# Altium schematic sheet RK3588-HDMI.SchDoc
size 420 x 297 mm; SheetNumber: 11; SheetTotal: 22
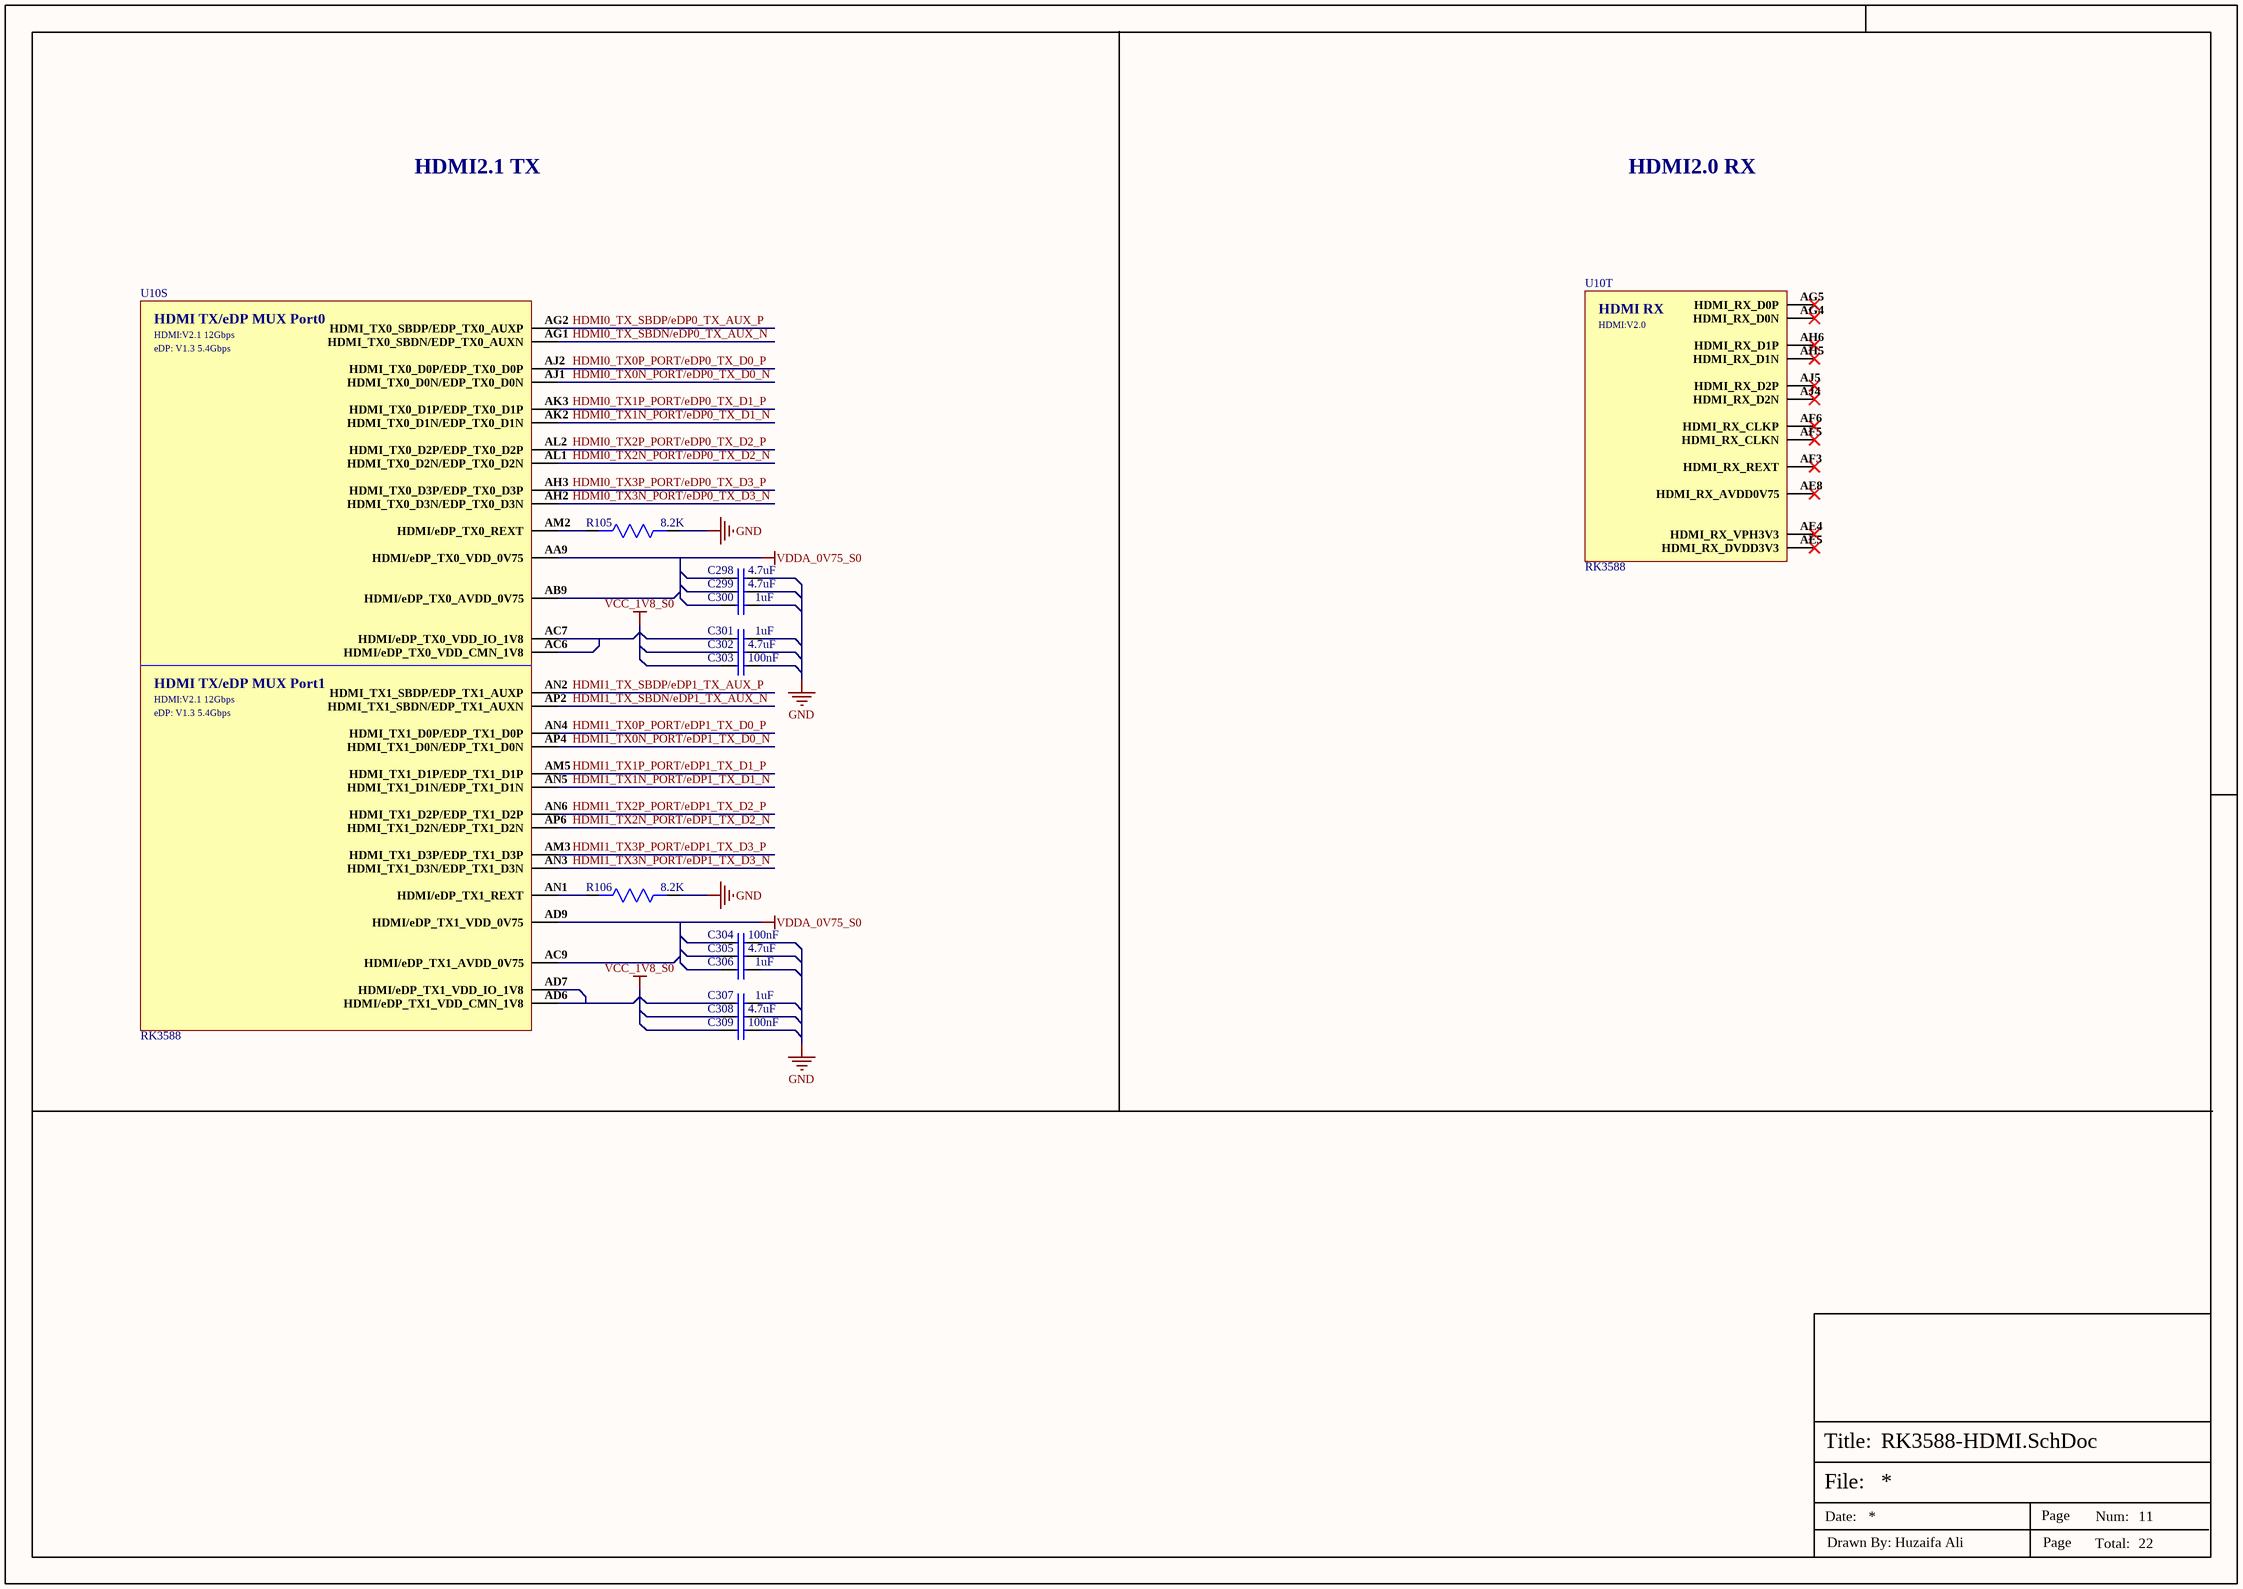
[diagram p0: RK3588-HDMI.SchDoc]

## Parts
C298  4.7uF  [Cap-0402]
C299  4.7uF  [Cap-0402]
C300  1uF  [CAP-0201]
C301  1uF  [CAP-0201]
C302  4.7uF  [Cap-0402]
C303  100nF  [CAP-0201]
C304  100nF  [CAP-0201]
C305  4.7uF  [Cap-0402]
C306  1uF  [CAP-0201]
C307  1uF  [CAP-0201]
C308  4.7uF  [Cap-0402]
C309  100nF  [CAP-0201]
R105  8.2K  [Res-0201]
R106  8.2K  [Res-0201]
U10  RK3588  [FCBGA-1088L]  (parts S,T of 26)

## Nets
GND: C298.2 C299.2 C300.2 C301.2 C302.2 C303.2 C304.2 C305.2 C306.2 C307.2 C308.2 C309.2 R105.1 R106.1
VCC_1V8_S0: C301.1 C302.1 C303.1 C307.1 C308.1 C309.1 U10.AC6(HDMI/eDP_TX0_VDD_CMN_1V8) U10.AC7(HDMI/eDP_TX0_VDD_IO_1V8) U10.AD6(HDMI/eDP_TX1_VDD_CMN_1V8) U10.AD7(HDMI/eDP_TX1_VDD_IO_1V8)
VDDA_0V75_S0: C298.1 C299.1 C300.1 C304.1 C305.1 C306.1 U10.AA9(HDMI/eDP_TX0_VDD_0V75) U10.AB9(HDMI/eDP_TX0_AVDD_0V75) U10.AC9(HDMI/eDP_TX1_AVDD_0V75) U10.AD9(HDMI/eDP_TX1_VDD_0V75)
HDMI0_TX0N_PORT/eDP0_TX_D0_N: U10.AJ1(HDMI_TX0_D0N/EDP_TX0_D0N)
HDMI0_TX0P_PORT/eDP0_TX_D0_P: U10.AJ2(HDMI_TX0_D0P/EDP_TX0_D0P)
HDMI0_TX1N_PORT/eDP0_TX_D1_N: U10.AK2(HDMI_TX0_D1N/EDP_TX0_D1N)
HDMI0_TX1P_PORT/eDP0_TX_D1_P: U10.AK3(HDMI_TX0_D1P/EDP_TX0_D1P)
HDMI0_TX2N_PORT/eDP0_TX_D2_N: U10.AL1(HDMI_TX0_D2N/EDP_TX0_D2N)
HDMI0_TX2P_PORT/eDP0_TX_D2_P: U10.AL2(HDMI_TX0_D2P/EDP_TX0_D2P)
HDMI0_TX3N_PORT/eDP0_TX_D3_N: U10.AH2(HDMI_TX0_D3N/EDP_TX0_D3N)
HDMI0_TX3P_PORT/eDP0_TX_D3_P: U10.AH3(HDMI_TX0_D3P/EDP_TX0_D3P)
HDMI0_TX_SBDN/eDP0_TX_AUX_N: U10.AG1(HDMI_TX0_SBDN/EDP_TX0_AUXN)
HDMI0_TX_SBDP/eDP0_TX_AUX_P: U10.AG2(HDMI_TX0_SBDP/EDP_TX0_AUXP)
HDMI1_TX0N_PORT/eDP1_TX_D0_N: U10.AP4(HDMI_TX1_D0N/EDP_TX1_D0N)
HDMI1_TX0P_PORT/eDP1_TX_D0_P: U10.AN4(HDMI_TX1_D0P/EDP_TX1_D0P)
HDMI1_TX1N_PORT/eDP1_TX_D1_N: U10.AN5(HDMI_TX1_D1N/EDP_TX1_D1N)
HDMI1_TX1P_PORT/eDP1_TX_D1_P: U10.AM5(HDMI_TX1_D1P/EDP_TX1_D1P)
HDMI1_TX2N_PORT/eDP1_TX_D2_N: U10.AP6(HDMI_TX1_D2N/EDP_TX1_D2N)
HDMI1_TX2P_PORT/eDP1_TX_D2_P: U10.AN6(HDMI_TX1_D2P/EDP_TX1_D2P)
HDMI1_TX3N_PORT/eDP1_TX_D3_N: U10.AN3(HDMI_TX1_D3N/EDP_TX1_D3N)
HDMI1_TX3P_PORT/eDP1_TX_D3_P: U10.AM3(HDMI_TX1_D3P/EDP_TX1_D3P)
HDMI1_TX_SBDN/eDP1_TX_AUX_N: U10.AP2(HDMI_TX1_SBDN/EDP_TX1_AUXN)
HDMI1_TX_SBDP/eDP1_TX_AUX_P: U10.AN2(HDMI_TX1_SBDP/EDP_TX1_AUXP)
NetR105_2: R105.2 U10.AM2(HDMI/eDP_TX0_REXT)
NetR106_2: R106.2 U10.AN1(HDMI/eDP_TX1_REXT)

Not connected (* = marked no-connect by the designer): U10 AE4(HDMI_RX_VPH3V3)* AE5(HDMI_RX_DVDD3V3)* AE8(HDMI_RX_AVDD0V75)* AF3(HDMI_RX_REXT)* AF5(HDMI_RX_CLKN)* AF6(HDMI_RX_CLKP)* AG4(HDMI_RX_D0N)* AG5(HDMI_RX_D0P)* AH5(HDMI_RX_D1N)* AH6(HDMI_RX_D1P)* AJ4(HDMI_RX_D2N)* AJ5(HDMI_RX_D2P)*

## Notes on the sheet
- HDMI2.1 TX
- HDMI2.0 RX
- File:
- Title:
- Date:
- Page
- Num:
- Total:
- Drawn By: Huzaifa Ali
- (in symbol RK3588, part S) HDMI TX/eDP MUX Port0; HDMI:V2.1 12Gbps; eDP: V1.3 5.4Gbps; HDMI TX/eDP MUX Port1
- (in symbol RK3588, part T) HDMI RX; HDMI:V2.0

## Library data of the parts
C298 C299 C302 C305 C308 = CC0402KRX5R6BB475: CAP CER 4.7UF 10V X5R 0402; Manufacturer: Yageo; Tolerance: 10%; Supplier 1: Farnell; Manufacturer Part Number: CC0402KRX5R6BB475; RoHS: Yes; Category: Ceramic Capacitors; Stock 1: 20000; Pricing 1: 10000=0.02310, 50000=0.02100 (GBP); Mount: Surface Mount; Case/Package: 0402; Case Code (Imperial): 0402; Case Code (Metric): 1005; Min Operating Temperature: -55°C; Max Operating Temperature: 85°C; Packaging: Cut Tape; Capacitance: 4.7uF; Voltage Rating: 10V; RoHS Compliant: Yes; ComponentLink1URL: http://www.yageo.com/documents/recent/UPY-GPHC_X5R_4V-to-50V_25.pdf?src-supplier=Digi-Key; ComponentLink1Description: http://www.yageo.com/documents/recent/UPY-GPHC_X5R_4V-to-50V_25.pdf?src-supplier=Digi-Key; Supplier Part Number 1: 3871698; LCSC Part Number: C326586
C300 C301 C306 C307 = CC0201KRX5R5BB105: CAP CER 1UF 6.3V X5R 0201; Manufacturer: Yageo; Tolerance: 10%; Supplier 1: Digi-Key; Manufacturer Part Number: CC0201KRX5R5BB105; RoHS: Yes; Category: Ceramic Capacitors; Stock 1: 1909543; Pricing 1: 1=0.10000, 10=0.04600, 50=0.02500, 100=0.02050, 500=0.01464, 1000=0.01150, 2500=0.01045, 5000=0.00962 (USD); Mount: Surface Mount; Case/Package: 0201; Case Code (Imperial): 0201; Case Code (Metric): 0603; Min Operating Temperature: -55°C; Max Operating Temperature: 85°C; Packaging: Cut Tape; Capacitance: 1uF; Voltage Rating: 6.3V; RoHS Compliant: Yes; ComponentLink1URL: http://www.yageo.com/documents/recent/UPY-GPHC_X5R_4V-to-50V_25.pdf?src-supplier=Digi-Key; ComponentLink1Description: http://www.yageo.com/documents/recent/UPY-GPHC_X5R_4V-to-50V_25.pdf?src-supplier=Digi-Key; ComponentLink2URL: https://www.yageo.com/upload/media/product/productsearch/datasheet/mlcc/UPY-GPHC_X5R_4V-to-50V_26.pdf?src-supplier=Digi-Key; ComponentLink2Description: https://www.yageo.com/upload/media/product/productsearch/datasheet/mlcc/UPY-GPHC_X5R_4V-to-50V_26.pdf?src-supplier=Digi-Key; Supplier Part Number 1: 311-3471-1-ND
C303 C309 = CC0201KRX5R5BB104: CAP CER 0.1UF 6.3V X5R 0201; Manufacturer: Yageo; Tolerance: 10%; Supplier 1: Digi-Key; Manufacturer Part Number: CC0201KRX5R5BB104; RoHS: Yes; Category: Ceramic Capacitors; Stock 1: 3711589; Pricing 1: 1=0.10000, 10=0.02100, 50=0.01160, 100=0.00960, 500=0.00682, 1000=0.00536, 2500=0.00487, 5000=0.00448 (USD); Mount: Surface Mount; Case/Package: 0201; Number of Pins: 2; Case Code (Imperial): 0201; Case Code (Metric): 0603; Min Operating Temperature: -55°C; Max Operating Temperature: 85°C; Capacitance: 100nF; Dielectric: X5R; Voltage Rating: 6.3V; Packaging: Tape and Reel; Package Quantity: 1; Voltage Rating (DC): 6.3V; Termination: SMD/SMT; Resistor Type: Ceramic; Series: CC; Length: 0.6mm; Width: 0.012inch; Height: 0.3mm; Thickness: 0.013inch; Depth: 0.3mm; Reach SVHC Compliant: Yes; Lead Free: Lead Free; Halogen Free: Halogen Free; RoHS Compliant: Yes; ComponentLink1URL: https://datasheet.ciiva.com/7656/1525783-7656597.pdf?src-supplier=Element14; ComponentLink1Description: https://datasheet.ciiva.com/7656/1525783-7656597.pdf?src-supplier=Element14; ComponentLink2URL: https://datasheet.ciiva.com/28450/1359354-28450200.pdf?src-supplier=Element14; ComponentLink2Description: https://datasheet.ciiva.com/28450/1359354-28450200.pdf?src-supplier=Element14; ComponentLink3URL: https://datasheet.ciiva.com/176/mlccorderingcode-176766.pdf?src-supplier=Digi-Key; ComponentLink3Description: https://datasheet.ciiva.com/176/mlccorderingcode-176766.pdf?src-supplier=Digi-Key; ComponentLink4URL: https://datasheet.ciiva.com/176/mlccorderingcode-176765.pdf?src-supplier=Digi-Key; ComponentLink4Description: https://datasheet.ciiva.com/176/mlccorderingcode-176765.pdf?src-supplier=Digi-Key; ComponentLink5URL: https://datasheet.ciiva.com/176/mlccorderingcode-176767.pdf?src-supplier=Digi-Key; ComponentLink5Description: https://datasheet.ciiva.com/176/mlccorderingcode-176767.pdf?src-supplier=Digi-Key; Supplier Part Number 1: 311-1408-1-ND
C304 = CC0201KRX5R6BB104: CAP CER 0.1UF 10V X5R 0201; Manufacturer: Yageo; Tolerance: 10%; Supplier 1: Mouser; Manufacturer Part Number: CC0201KRX5R6BB104; RoHS: Yes; Category: Ceramic Capacitors; Stock 1: 824403; Pricing 1: 1=0.10000, 10=0.02400, 50=0.02400, 100=0.01900, 1000=0.01100, 10000=0.00900 (USD); Mount: Surface Mount; Case/Package: 0201; Case Code (Imperial): 0201; Case Code (Metric): 0603; Weight: 6E-06oz; Min Operating Temperature: -55°C; Max Operating Temperature: 85°C; Capacitance: 100nF; Dielectric: X5R; Voltage Rating (DC): 10V; Packaging: Tape and Reel; Termination: SMD/SMT; Resistor Type: Ceramic; Voltage Rating: 10V; Series: CC; Construction: Flat; Length: 0.6mm; Width: 0.012inch; Height: 0.3mm; Thickness: 0.013inch; Depth: 0.3mm; Radiation Hardening: No; Lead Free: Lead Free; Halogen Free: Halogen Free; RoHS Compliant: Yes; ComponentLink1URL: https://datasheet.ciiva.com/11587/upy-gphc-x5r-4v-to-50v-12-11587190.pdf?src-supplier=Avnet; ComponentLink1Description: https://datasheet.ciiva.com/11587/upy-gphc-x5r-4v-to-50v-12-11587190.pdf?src-supplier=Avnet; Supplier Part Number 1: 603-CC201KRX5R6BB104; LCSC Part Number: C190183
R105 R106 = RC0201FR-078K2L: RES 8.2K OHM 1% 1/20W 0201; Manufacturer: Yageo; Resistance: 8.2kR; Power Rating: 50mW; Voltage Rating: 25V; Temperature Coefficient: 200ppm/°C; Supplier 1: Digi-Key; Manufacturer Part Number: RC0201FR-078K2L; RoHS: Yes; Category: Chip SMD Resistors; Stock 1: 282340; Pricing 1: 1=0.10000, 10=0.03700, 100=0.01500, 1000=0.00672, 2500=0.00583, 5000=0.00482 (USD); Case/Package: 0201; Case Code (Metric): 0603; Case Code (Imperial): 0201; Min Operating Temperature: -55°C; Max Operating Temperature: 125°C; Package Quantity: 10000; Packaging: Tape and Reel; Tolerance: 1%; Resistor Type: Thick Film; Number of Terminations: 2; Termination: SMD/SMT; Max Power Dissipation: 50mW; Features: Moisture Resistant; Series: RC; Resistance Tolerance: 1%; Length: 0.024inch; Width: 0.3mm; Height: 0.01inch; Reach SVHC Compliant: Yes; Lead Free: Lead Free; RoHS Compliant: Yes; ComponentLink1URL: https://datasheet.ciiva.com/14985/pyu-r-int-thick-7-14985436.pdf?src-supplier=Digi-Key; ComponentLink1Description: https://datasheet.ciiva.com/14985/pyu-r-int-thick-7-14985436.pdf?src-supplier=Digi-Key; Supplier Part Number 1: YAG2353CT-ND
U10 = RK3588: Power Management IC; Manufacturer Part Number: RK3588LP4XEVB; Manufacturer: Rockchip; LCSC Part Number: *; Item Type: IC